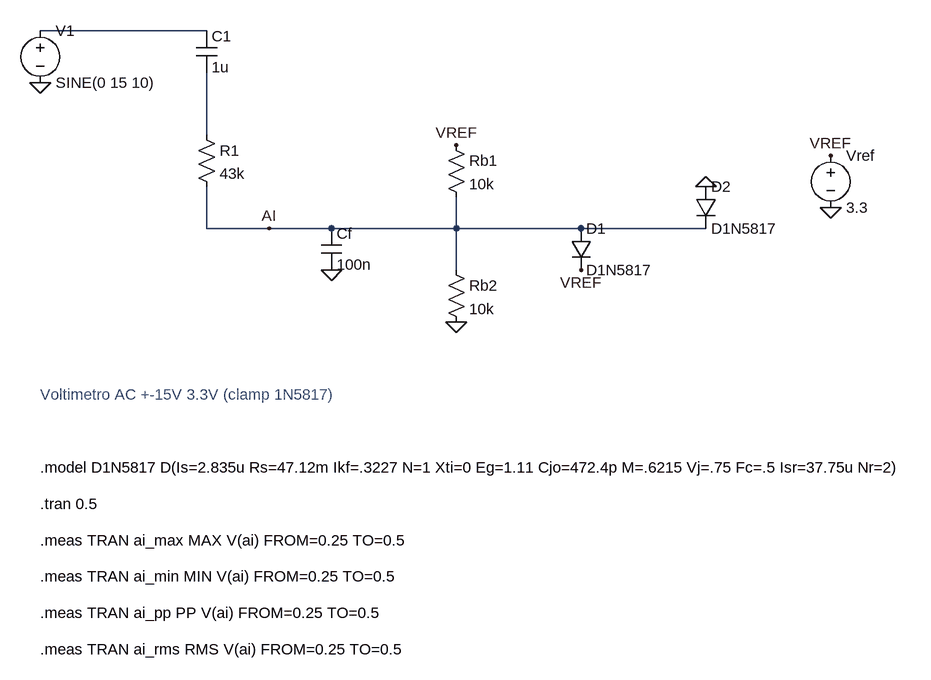
[diagram p0: schematic voltimetro_ac.asc]
voltimetro_ac.asc, the LTspice schematic file:
Version 4
SHEET 1 1300 1104
WIRE 0 16 256 16
WIRE 256 80 256 176
WIRE 256 256 256 320
WIRE 256 320 352 320
WIRE 352 320 448 320
WIRE 448 320 640 320
WIRE 640 272 640 320
WIRE 640 320 640 384
WIRE 640 320 832 320
WIRE 832 320 1024 320
FLAG 0 96 0
FLAG 352 320 AI
FLAG 448 384 0
FLAG 640 192 VREF
FLAG 640 464 0
FLAG 832 384 VREF
FLAG 1024 256 0
FLAG 1216 208 VREF
FLAG 1216 288 0
SYMBOL voltage 0 0 R0
SYMATTR InstName V1
SYMATTR Value SINE(0 15 10)
SYMBOL cap 240 16 R0
SYMATTR InstName C1
SYMATTR Value 1u
SYMBOL res 240 160 R0
SYMATTR InstName R1
SYMATTR Value 43k
SYMBOL cap 432 320 R0
SYMATTR InstName Cf
SYMATTR Value 100n
SYMBOL res 624 176 R0
SYMATTR InstName Rb1
SYMATTR Value 10k
SYMBOL res 624 368 R0
SYMATTR InstName Rb2
SYMATTR Value 10k
SYMBOL diode 816 320 R0
SYMATTR InstName D1
SYMATTR Value D1N5817
SYMBOL diode 1008 256 R0
SYMATTR InstName D2
SYMATTR Value D1N5817
SYMBOL voltage 1216 192 R0
SYMATTR InstName Vref
SYMATTR Value 3.3
TEXT 0 576 Left 2 ;Voltimetro AC +-15V 3.3V (clamp 1N5817)
TEXT 0 688 Left 2 !.model D1N5817 D(Is=2.835u Rs=47.12m Ikf=.3227 N=1 Xti=0 Eg=1.11 Cjo=472.4p M=.6215 Vj=.75 Fc=.5 Isr=37.75u Nr=2)
TEXT 0 744 Left 2 !.tran 0.5
TEXT 0 800 Left 2 !.meas TRAN ai_max MAX V(ai) FROM=0.25 TO=0.5
TEXT 0 856 Left 2 !.meas TRAN ai_min MIN V(ai) FROM=0.25 TO=0.5
TEXT 0 912 Left 2 !.meas TRAN ai_pp PP V(ai) FROM=0.25 TO=0.5
TEXT 0 968 Left 2 !.meas TRAN ai_rms RMS V(ai) FROM=0.25 TO=0.5

The netlist it stands for:
* voltimetro_ac.asc
V1 N001 0 SINE(0 15 10)
C1 N001 N002 1u
R1 N002 AI 43k
Cf AI 0 100n
Rb1 VREF AI 10k
Rb2 AI 0 10k
D1 AI VREF D1N5817
D2 0 AI D1N5817
Vref VREF 0 3.3
.model D D
.lib standard.dio
* Voltimetro AC +-15V 3.3V (clamp 1N5817)
.model D1N5817 D(Is=2.835u Rs=47.12m Ikf=.3227 N=1 Xti=0 Eg=1.11 Cjo=472.4p M=.6215 Vj=.75 Fc=.5 Isr=37.75u Nr=2)
.tran 0.5
.meas TRAN ai_max MAX V(ai) FROM=0.25 TO=0.5
.meas TRAN ai_min MIN V(ai) FROM=0.25 TO=0.5
.meas TRAN ai_pp PP V(ai) FROM=0.25 TO=0.5
.meas TRAN ai_rms RMS V(ai) FROM=0.25 TO=0.5
.backanno
.end